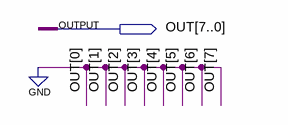
[diagram p0: schematic sheet]
// Quartus schematic Zero.bdf as structural Verilog: 0 symbols, 1 pins
module Zero (
  output [7:0] OUT
);


  assign OUT = {8{1'b0}};
endmodule
